# Altium schematic sheet Atrium_Charging_Case.SchDoc
size 420 x 297 mm; Symbol: Drawing-Symbol_A4; @Project Name: Atrium; @Page Count: 1; @Update Date: 2026-11-08; @Create Date: 2026-11-08; @Schematic Name: Schematic1; @Page No: 1; @Page Name: P1; Company: EasyEDA.com; Version: V1.0; Page Size: A4; Device: Drawing-Symbol_A4; @Create Time: 16:57:37; @Update Time: 16:57:37; Border: 1; Width: 1655; Height: 1170; Region Start: 1; X Region Count: 6; Y Region Count: 4; Blade Width: 10; Title Block Position: 3; @Board Name: Charging_Case
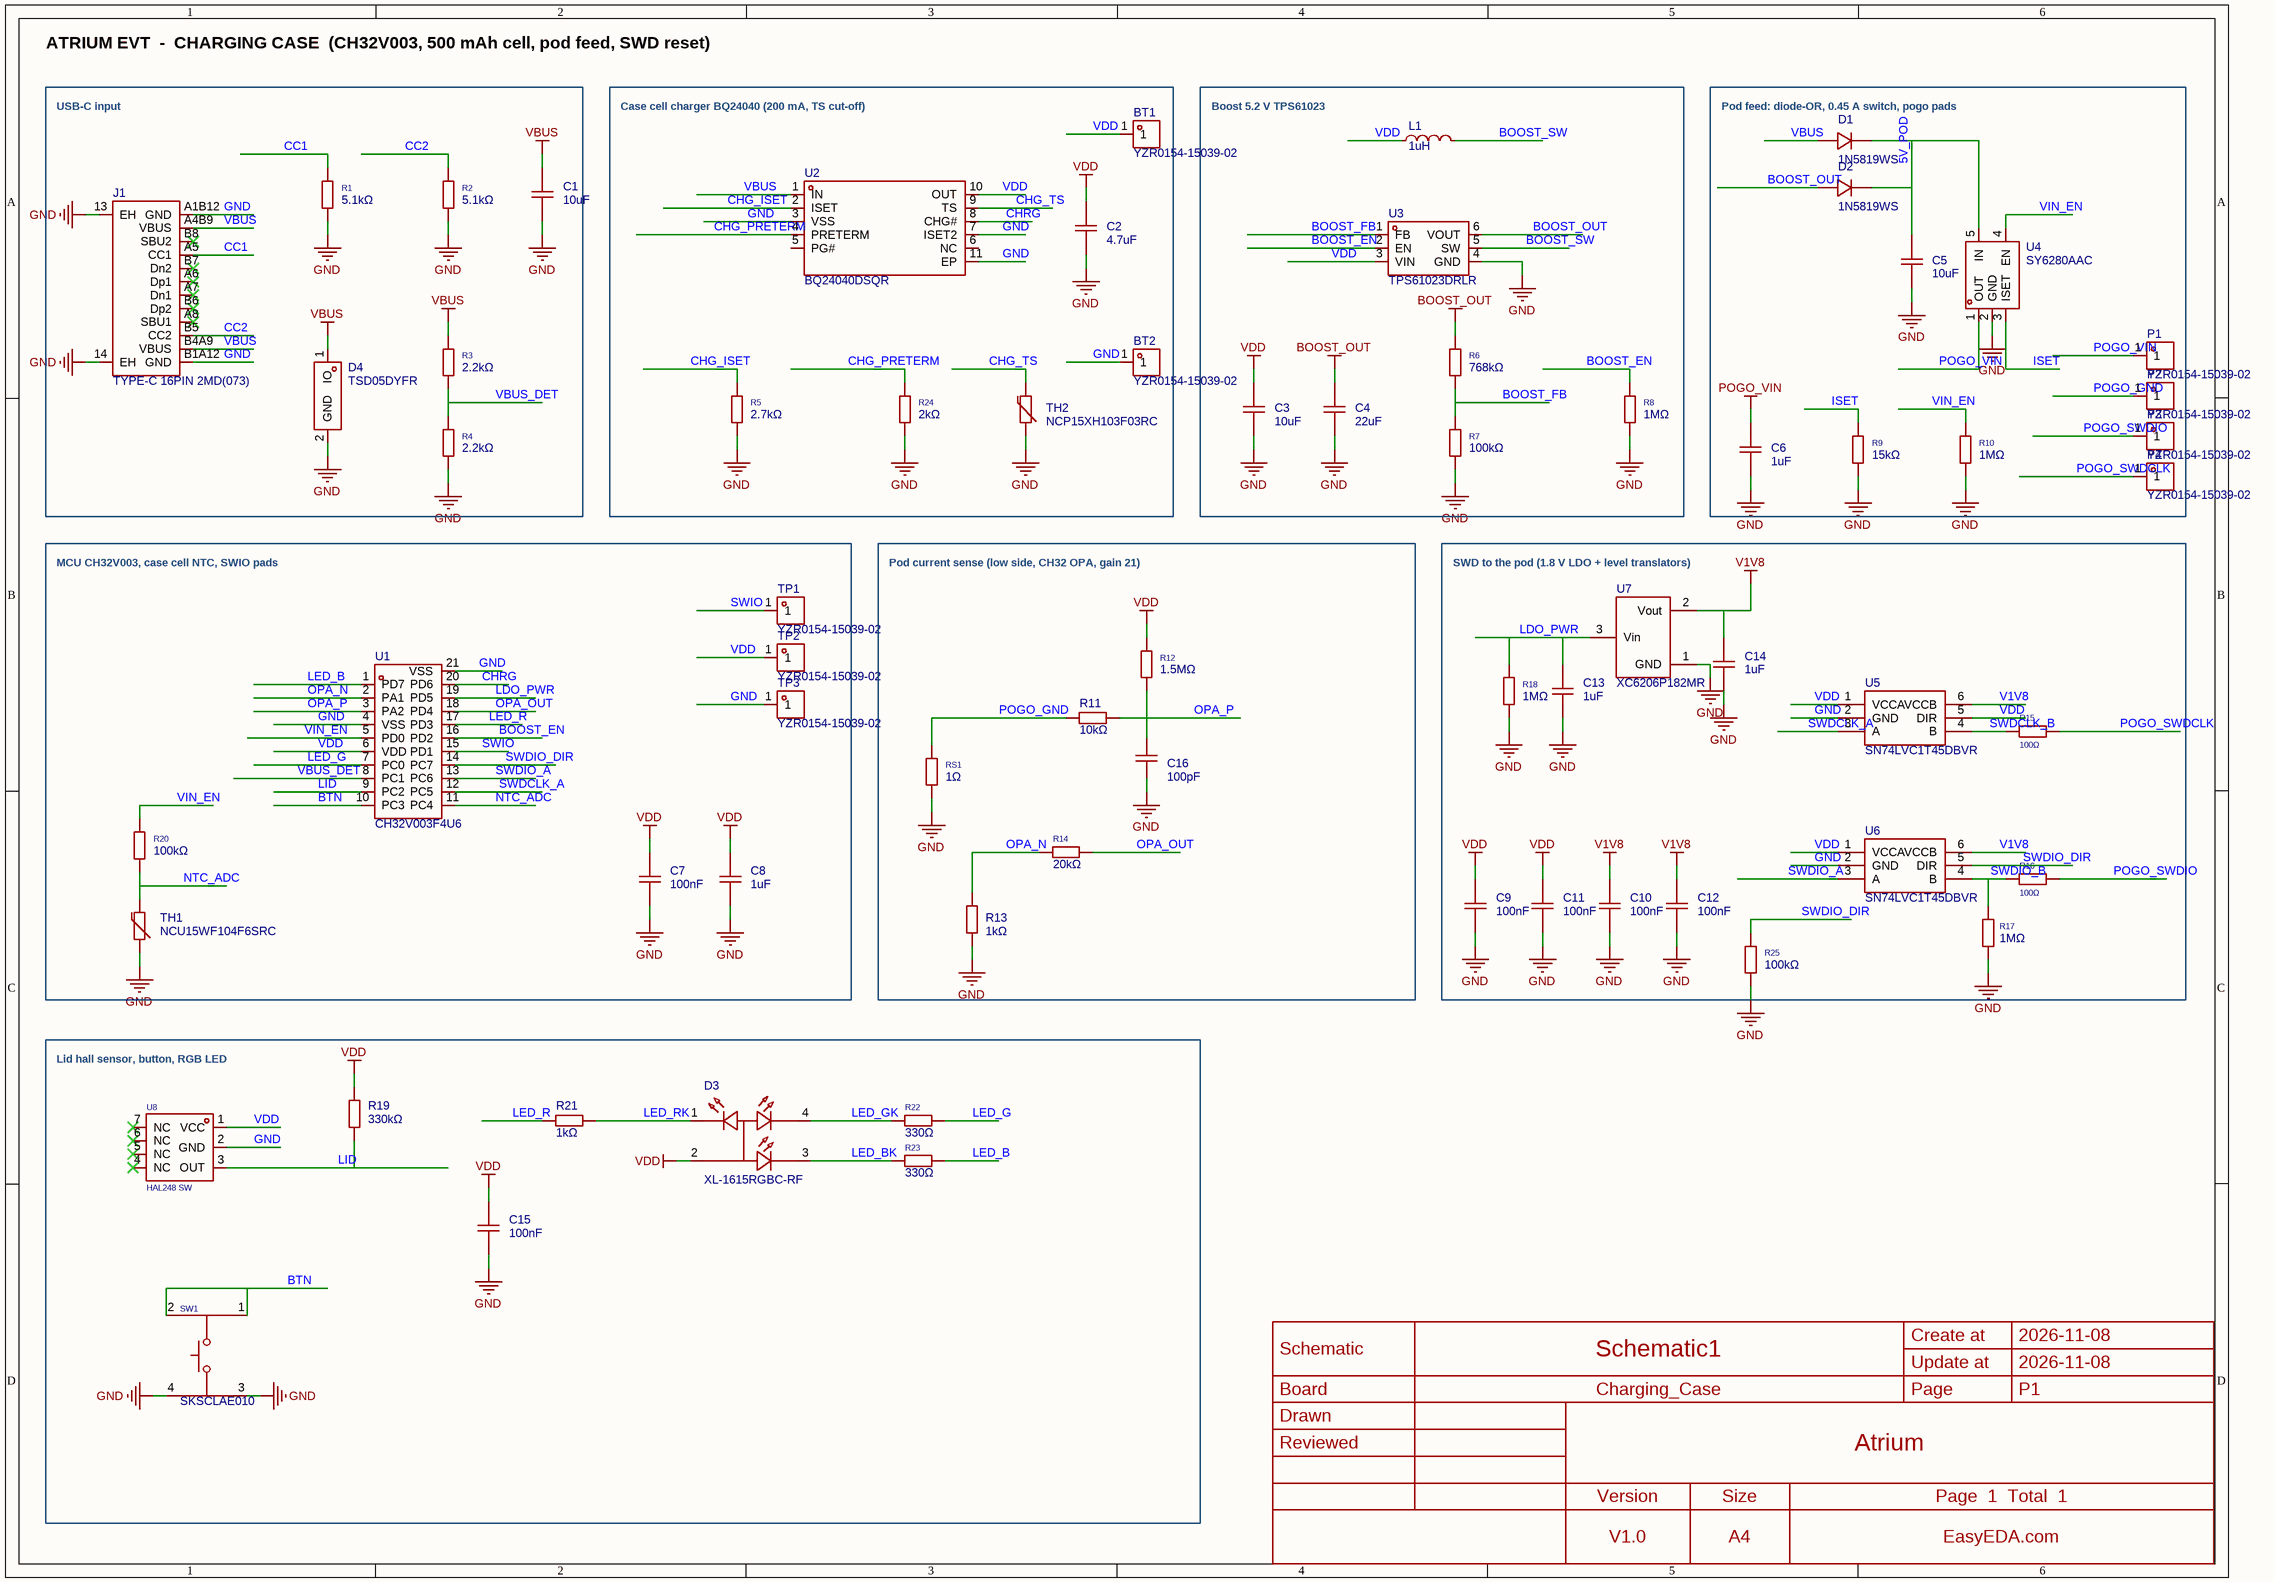
[diagram p0: Atrium_Charging_Case.SchDoc]

## Parts
BT1  YZR0154-15039-02  [TESTPOINT-SMD_BD1.5-H3.9]
BT2  YZR0154-15039-02  [TESTPOINT-SMD_BD1.5-H3.9]
C1  10uF  [C0603]
C2  4.7uF  [C0603]
C3  10uF  [C0603]
C4  22uF  [C0805]
C5  10uF  [C0603]
C6  1uF  [C0402]
C7  100nF  [C0402]
C8  1uF  [C0402]
C9  100nF  [C0402]
C10  100nF  [C0402]
C11  100nF  [C0402]
C12  100nF  [C0402]
C13  1uF  [C0402]
C14  1uF  [C0402]
C15  100nF  [C0402]
C16  100pF  [C0603]
D1  1N5819WS  [SOD-323_L1.8-W1.3-LS2.5-RD]
D2  1N5819WS  [SOD-323_L1.8-W1.3-LS2.5-RD]
D3  XL-1615RGBC-RF  [LED-ARRAY-SMD_4P-L1.6-W1.5-BR_XL-1615RGBC-RF]
D4  TSD05DYFR  [SOD-323_L1.7-W1.3-LS2.6_DYF0002A]
J1  TYPE-C 16PIN 2MD(073)  [USB-C-SMD_TYPE-C-16PIN-2MD-073]
L1  1uH  [IND-SMD_L2.5-W2.0_WPN252012H]
P1  YZR0154-15039-02  [TESTPOINT-SMD_BD1.5-H3.9]
P2  YZR0154-15039-02  [TESTPOINT-SMD_BD1.5-H3.9]
P3  YZR0154-15039-02  [TESTPOINT-SMD_BD1.5-H3.9]
P4  YZR0154-15039-02  [TESTPOINT-SMD_BD1.5-H3.9]
R1  5.1kΩ  [R0402]
R2  5.1kΩ  [R0402]
R3  2.2kΩ  [R0402]
R4  2.2kΩ  [R0402]
R5  2.7kΩ  [R0402]
R6  768kΩ  [R0402]
R7  100kΩ  [R0402]
R8  1MΩ  [R0402]
R9  15kΩ  [R0402]
R10  1MΩ  [R0402]
R11  10kΩ  [R0402]
R12  1.5MΩ  [R0402]
R13  1kΩ  [R0402]
R14  20kΩ  [R0402]
R15  100Ω  [R0402]
R16  100Ω  [R0402]
R17  1MΩ  [R0402]
R18  1MΩ  [R0402]
R19  330kΩ  [R0402]
R20  100kΩ  [R0402]
R21  1kΩ  [R0402]
R22  330Ω  [R0402]
R23  330Ω  [R0402]
R24  2kΩ  [R0402]
R25  100kΩ  [R0402]
RS1  1Ω  [R0603]
SW1  SKSCLAE010  [SW-SMD_4P-L3.5-W2.9-P1.30-LS4.8]
TH1  NCU15WF104F6SRC  [R0402]
TH2  NCP15XH103F03RC  [R0402]
TP1  YZR0154-15039-02  [TESTPOINT-SMD_BD1.5-H3.9]
TP2  YZR0154-15039-02  [TESTPOINT-SMD_BD1.5-H3.9]
TP3  YZR0154-15039-02  [TESTPOINT-SMD_BD1.5-H3.9]
U1  CH32V003F4U6  [QFN-20_L3.0-W3.0-P0.40-TL-EP1.7]
U2  BQ24040DSQR  [WSON-10_L2.0-W2.0-P0.40-BL-EP]
U3  TPS61023DRLR  [SOT-563-6_L1.6-W1.2-P0.5-LS1.6-BR]
U4  SY6280AAC  [SOT-23-5_L3.0-W1.7-P0.95-LS2.8-BL]
U5  SN74LVC1T45DBVR  [SOT-23-6_L2.9-W1.6-P0.95-LS2.8-BR]
U6  SN74LVC1T45DBVR  [SOT-23-6_L2.9-W1.6-P0.95-LS2.8-BR]
U7  XC6206P182MR  [SOT-23-3_L2.9-W1.6-P1.90-LS2.8-BR]
U8  HAL248 SW  [DFN-6_HAL248_SW]

## Blocks framed on the sheet
USB-C input: C1 D4 J1 R1-R4
Case cell charger BQ24040 (200 mA, TS cut-off): BT1 BT2 C2 R5 R24 TH2 U2
Boost 5.2 V TPS61023: C3 C4 L1 R6-R8 U3
Pod feed: diode-OR, 0.45 A switch, pogo pads: C5 C6 D1 D2 P1-P4 R9 R10 U4
MCU CH32V003, case cell NTC, SWIO pads: C7 C8 R20 TH1 TP1-TP3 U1
Pod current sense (low side, CH32 OPA, gain 21): C16 R11-R14 RS1
SWD to the pod (1.8 V LDO + level translators): C9-C14 R15-R18 R25 U5-U7
Lid hall sensor, button, RGB LED: C15 D3 R19 R21-R23 SW1 U8

## Nets
BOOST_OUT: C4.1 D2.2 R6.1 U3.6(VOUT)
GND: BT2.1 C1.2 C2.2 C3.2 C4.2 C5.2 C6.2 C7.2 C8.2 C9.2 C10.2 C11.2 C12.2 C13.2 C14.2 C15.2 C16.2 D4.2(GND) J1.13(EH) J1.14(EH) J1.A1B12(GND) J1.B1A12(GND) R1.2 R2.2 R4.2 R5.2 R7.2 R8.2 R9.2 R10.2 R13.2 R17.2 R18.2 R24.2 R25.2 RS1.2 SW1.3 SW1.4 TH1.2 TH2.2 TP3.1 U1.4(VSS) U1.21(VSS) U2.3(VSS) U2.7(ISET2) U2.11(EP) U3.4(GND) U4.2(GND) U5.2(GND) U6.2(GND) U7.1(GND) U8.2(GND)
POGO_VIN: C6.1 P1.1 U4.1(OUT)
V1V8: C10.1 C12.1 C14.1 U5.6(VCCB) U6.6(VCCB) U7.2(Vout)
VBUS: C1.1 D1.2 D4.1(IO) J1.A4B9(VBUS) J1.B4A9(VBUS) R3.1 U2.1(IN)
VDD: BT1.1 C2.1 C3.1 C7.1 C8.1 C9.1 C11.1 C15.1 D3.2(COM+) L1.1 R12.1 R19.1 TP2.1 U1.6(VDD) U2.10(OUT) U3.3(VIN) U5.1(VCCA) U5.5(DIR) U6.1(VCCA) U8.1(VCC)
5V_POD: C5.1 D1.1 D2.1 U4.5(IN)
BOOST_EN: R8.1 U1.16(PD2) U3.2(EN)
BOOST_FB: R6.2 R7.1 U3.1(FB)
BOOST_SW: L1.2 U3.5(SW)
BTN: SW1.1 SW1.2 U1.10(PC3)
CC1: J1.A5(CC1) R1.1
CC2: J1.B5(CC2) R2.1
CHG_ISET: R5.1 U2.2(ISET)
CHG_PRETERM: R24.1 U2.4(PRETERM)
CHG_TS: TH2.1 U2.9(TS)
CHRG: U1.20(PD6) U2.8(CHG#)
ISET: R9.1 U4.3(ISET)
LDO_PWR: C13.1 R18.1 U1.19(PD5) U7.3(Vin)
LED_B: R23.1 U1.1(PD7)
LED_BK: D3.3(B-) R23.2
LED_G: R22.1 U1.7(PC0)
LED_GK: D3.4(G-) R22.2
LED_R: R21.1 U1.17(PD3)
LED_RK: D3.1(R-) R21.2
LID: R19.2 U1.9(PC2) U8.3(OUT)
NTC_ADC: R20.2 TH1.1 U1.11(PC4)
OPA_N: R13.1 R14.1 U1.2(PA1)
OPA_OUT: R14.2 U1.18(PD4)
OPA_P: C16.1 R11.2 R12.2 U1.3(PA2)
POGO_GND: P2.1 R11.1 RS1.1
POGO_SWDCLK: P4.1 R15.2
POGO_SWDIO: P3.1 R16.2
SWDCLK_A: U1.12(PC5) U5.3(A)
SWDCLK_B: R15.1 U5.4(B)
SWDIO_A: U1.13(PC6) U6.3(A)
SWDIO_B: R16.1 R17.1 U6.4(B)
SWDIO_DIR: R25.1 U1.14(PC7) U6.5(DIR)
SWIO: TP1.1 U1.15(PD1)
VBUS_DET: R3.2 R4.1 U1.8(PC1)
VIN_EN: R10.1 R20.1 U1.5(PD0) U4.4(EN)

Not connected (* = marked no-connect by the designer): J1 A6(Dp1)* A7(Dn1)* A8(SBU1)* B6(Dp2)* B7(Dn2)* B8(SBU2)*; U2 5(PG#) 6(NC); U8 4(NC)* 5(NC)* 6(NC)* 7(NC)*

## Notes on the sheet
- ATRIUM EVT  -  CHARGING CASE  (CH32V003, 500 mAh cell, pod feed, SWD reset)
- Create at
- 2026-11-08
- Schematic
- Board
- Schematic1
- Charging_Case
- Update at
- Page
- P1
- Drawn
- Reviewed
- Atrium
- Version
- V1.0
- Size
- A4
- Page  1  Total  1
- EasyEDA.com

## Library data of the parts
BT1 BT2 P1-P4 TP1-TP3 = YZR0154-15039-02: Type:Pogo Pin Number of Pins:1P Overall Length/Height:3.9mm Operational Height:3.1mm Contact Resistance:50mΩ Elastic Life:10000 times Current Rating:1A Voltage Rating:12V Contact Material:Lead-Free Copper Contact Plating:Gold Operating Temperature:-20℃~+7; Manufacturer: Xinyangze(鑫扬泽); Add into BOM: no; Overall Length/Height: 3.9mm; Operational Height: 3.1mm; Contact Resistance: 50mΩ; Current Rating: 1A; Voltage Rating: 12V; Symbol: YZR0154-15039-02; Device: YZR0154-15039-02; Convert to PCB: no; LCSC Part Name: POGO PIN贴片型弹簧顶针; Supplier Part: C5157388; Manufacturer Part: YZR0154-15039-02; Supplier Footprint: -; JLCPCB Part Class: Extended Part; Datasheet: https://item.szlcsc.com/datasheet/YZR0154-15039-02/5795506.html; Supplier: LCSC; Type: Pogo Pin; Number of Pins: 1P; Elastic Life: 10000 times; Contact Material: Lead-Free Copper; Contact Plating: Gold; Operating Temperature: -20℃~+70℃; FootprintName: TESTPOINT-SMD_BD1.5-H3.9
C1 C3 C5 = CL10A106KP8NNNC: Capacitance:10uF Tolerance:±10% Tolerance:±10% Voltage Rating:10V Temperature Coefficient:X5R; Manufacturer: SAMSUNG(三星); Add into BOM: yes; 3D Model: 624118aa3cc7497086c383c2d72e08520819f05c4eef4c71ace90d822a990e87; 3D Model Transform: 62.992,31.496,0,0,0,0,0,0,0; Tolerance: ±10%; Voltage Rating: 10V; Temperature Coefficient: X5R; ModelName: C0603_L1.6-W0.8-H0.8; Symbol: CL10A106KP8NNNC; Device: CL10A106KP8NNNC; Convert to PCB: yes; LCSC Part Name: 10uF ±10% 10V; Supplier Part: C19702; Manufacturer Part: CL10A106KP8NNNC; Supplier Footprint: 0603; JLCPCB Part Class: Basic Part; Datasheet: https://item.szlcsc.com/datasheet/CL10A106KP8NNNC/20411.html; Supplier: LCSC; Value: 10uF; FootprintName: C0603
C2 = CL10A475KO8NNNC: Capacitance:4.7uF Tolerance:±10% Tolerance:±10% Voltage Rating:16V Temperature Coefficient:X5R; Manufacturer: SAMSUNG(三星); Add into BOM: yes; 3D Model: 624118aa3cc7497086c383c2d72e08520819f05c4eef4c71ace90d822a990e87; 3D Model Transform: 62.992,31.496,0,0,0,0,0,0,0; Tolerance: ±10%; Voltage Rating: 16V; Temperature Coefficient: X5R; ModelName: C0603_L1.6-W0.8-H0.8; Symbol: CL10A475KO8NNNC; Device: CL10A475KO8NNNC; Convert to PCB: yes; LCSC Part Name: 4.7uF ±10% 16V; Supplier Part: C19666; Manufacturer Part: CL10A475KO8NNNC; Supplier Footprint: 0603; JLCPCB Part Class: Basic Part; Datasheet: https://item.szlcsc.com/datasheet/CL10A475KO8NNNC/20375.html; Supplier: LCSC; Value: 4.7uF; FootprintName: C0603
C4 = CL21A226MAQNNNE: Capacitance:22uF Tolerance:±20% Tolerance:±20% Voltage Rating:25V Temperature Coefficient:X5R; Manufacturer: SAMSUNG(三星); Manufacturer Part: CL21A226MAYNNNE; Add into BOM: yes; Tolerance: ±20%; Voltage Rating: 25V; Temperature Coefficient: X5R; ModelId: 8c88e81f49c6409b980720ec8953afb60819f05c4eef4c71ace90d822a990e87; ModelName: C0805_L2.0-W1.3-H1.3; ModelTransform: 78.74,51.181,0,0,0,0,0,0.0005,0; Symbol: CL21A226MAQNNNE; Device: CL21A226MAQNNNE; Convert to PCB: yes; Supplier: LCSC; Supplier Part: C602037; LCSC Part Name: 22uF ±20% 25V; Supplier Footprint: 0805; JLCPCB Part Class: Basic Part; Datasheet: https://item.szlcsc.com/datasheet/CL21A226MAQNNNE/46786.html; Value: 22uF; FootprintName: C0805
C6 C8 C13 C14 = CL05A105KA5NQNC: Capacitance:1uF Tolerance:±10% Tolerance:±10% Voltage Rating:25V Temperature Coefficient:X5R; Manufacturer: SAMSUNG(三星); Add into BOM: yes; 3D Model: b7d13df3e9464d7a99d0651d1a5b4d570819f05c4eef4c71ace90d822a990e87; 3D Model Transform: 39.37,19.685,0,0,0,0,0,0,0; Tolerance: ±10%; Voltage Rating: 25V; Temperature Coefficient: X5R; ModelName: C0402_L1.0-W0.5-H0.5; Symbol: CL05A105KA5NQNC; Device: CL05A105KA5NQNC; Convert to PCB: yes; LCSC Part Name: 1uF ±10% 25V; Supplier Part: C52923; Manufacturer Part: CL05A105KA5NQNC; Supplier Footprint: 0402; JLCPCB Part Class: Basic Part; Datasheet: https://item.szlcsc.com/datasheet/CL05A105KA5NQNC/53938.html; Supplier: LCSC; Value: 1uF; FootprintName: C0402
C7 C9-C12 C15 = CL05B104KO5NNNC: Capacitance:100nF Tolerance:±10% Tolerance:±10% Voltage Rating:16V Temperature Coefficient:X7R; Manufacturer: SAMSUNG(三星); Add into BOM: yes; 3D Model: b7d13df3e9464d7a99d0651d1a5b4d570819f05c4eef4c71ace90d822a990e87; 3D Model Transform: 39.37,19.685,0,0,0,0,0,0,0; Tolerance: ±10%; Voltage Rating: 16V; Temperature Coefficient: X7R; ModelName: C0402_L1.0-W0.5-H0.5; Symbol: CL05B104KO5NNNC; Device: CL05B104KO5NNNC; Convert to PCB: yes; LCSC Part Name: 100nF ±10% 16V; Supplier Part: C1525; Manufacturer Part: CL05B104KO5NNNC; Supplier Footprint: 0402; JLCPCB Part Class: Basic Part; Datasheet: https://item.szlcsc.com/datasheet/CL05B104KO5NNNC/1877.html; Supplier: LCSC; Value: 100nF; FootprintName: C0402
C16 = CL10C101JB8NNNC: Capacitance:100pF Tolerance:±5% Tolerance:±5% Voltage Rating:50V Temperature Coefficient:C0G; Manufacturer: SAMSUNG(三星); Add into BOM: yes; Tolerance: ±5%; Voltage Rating: 50V; Temperature Coefficient: C0G; ModelId: 624118aa3cc7497086c383c2d72e08520819f05c4eef4c71ace90d822a990e87; ModelName: C0603_L1.6-W0.8-H0.8; ModelTransform: 62.992,31.496,0,0,0,0,0,0,0; Symbol: CL10C101JB8NNNC; Device: CL10C101JB8NNNC; Convert to PCB: yes; Manufacturer Part: CL10C101JB8NNNC; Supplier: LCSC; Supplier Part: C14858; LCSC Part Name: 100pF ±5% 50V; Supplier Footprint: 0603; JLCPCB Part Class: Basic Part; Datasheet: https://item.szlcsc.com/datasheet/CL10C101JB8NNNC/15530.html; Value: 100pF; FootprintName: C0603
D1 D2 = B5819WS: Forward Voltage (Vf@If):600mV@1A Reverse Voltage (Vr):40V Average Rectified Current (Io):1A; Manufacturer: Hottech(合科泰); Symbol: B5819WS_C179554; Add into BOM: yes; Reverse Voltage (Vr): 40V; Average Rectified Current (Io): 1A; ModelId: 533ebfb2f206414f9035ed0ccba1097d0819f05c4eef4c71ace90d822a990e87; ModelTransform: 104.3305,51.181,0,0,0,0,0,-0.004,0; Device: B5819WS; Convert to PCB: yes; Manufacturer Part: 1N5819WS; Supplier: LCSC; Supplier Part: C191023; LCSC Part Name: 电压:40V 电流:1A; Supplier Footprint: SOD-323; JLCPCB Part Class: Extended Part; Datasheet: https://atta.szlcsc.com/upload/public/pdf/source/20180131/C179554_15173931515471329165.pdf; Forward Voltage (Vf@If): 600mV@1A; FootprintName: SOD-323_L1.8-W1.3-LS2.5-RD; ModelName: SOD-323_L1.8-W1.3-LS2.5-RD
D3 = XL-1615RGBC-RF: Diode Configuration:Common Anode Dominant Wavelength - R:620nm~625nm Dominant Wavelength - R:620nm~625nm Dominant Wavelength - G:515nm~530nm Dominant Wavelength - G:515nm~530nm Dominant Wavelength - B:460nm~470nm Dominant Wavelength - B:460nm~470nm Viewin; Manufacturer: XINGLIGHT(成兴光); Add into BOM: yes; Viewing Angle: 120°; Lens Color: Water Clear; Antistatic Capacity: B:2000V；R:2000V；G:2000V; Peak Wavelength - R: 625nm; Peak Wavelength - G: 515nm; Peak Wavelength - B: 465nm; Installation Method: Top-mount; Luminous Intensity - R: 100mcd~180mcd; Luminous Intensity - G: 350mcd~800mcd; Luminous Intensity - B: 120mcd~180mcd; Forward Voltage(Vf) - R: 1.8V~2.4V; Forward Voltage(Vf) - G: 2.6V~3.4V; Forward Current - R: 20mA; Power(Watts) - R: 50mW; Power(Watts) - G: 70mW; ModelId: 6557e66919bb465dbfbf77dbddbd30e00819f05c4eef4c71ace90d822a990e87; ModelTransform: 63.823,59.4487,0,0,0,0,0,0,0; Symbol: XL-1615RGBC-RF; Device: XL-1615RGBC-RF; Convert to PCB: yes; Manufacturer Part: XL-1615RGBC-RF; Supplier: LCSC; Supplier Part: C965840; LCSC Part Name: 1615七彩（共阳）贴片式发光二极管; Supplier Footprint: SMD-4P,1.6x1.5mm; JLCPCB Part Class: Extended Part; Datasheet: https://item.szlcsc.com/datasheet/XL-1615RGBC-RF/1051449.html; Diode Configuration: Common Anode; Dominant Wavelength - R: 620nm~625nm; Dominant Wavelength - G: 515nm~530nm; Dominant Wavelength - B: 460nm~470nm; Operating Temperature: -30℃~+85℃; Lamp Holder Type: -; Length: 1.6mm; Width: 1.5mm; Height: 0.6mm; Pitch: -; Forward Voltage(Vf) - B: 2.6V~3.4V; Forward Current - G: 20mA; Forward Current - B: 20mA; Power(Watts) - B: 70mW; FootprintName: LED-ARRAY-SMD_4P-L1.6-W1.5-BR_XL-1615RGBC-RF; ModelName: LED-ARRAY-SMD_4P-L1.6-W1.5-BR_XL-1615RGBC-RF
D4 = TSD05DYFR: Reverse Stand-Off Voltage (Vrwm):5.5V Clamping Voltage:15V Peak Pulse Current (Ipp):60A@8/20us Peak Pulse Power Dissipation (Ppp):529W@8/20us Voltage - Breakdown:6V Reverse Leakage Current (Ir):50nA Operating Temperature:-55℃~+150℃ Operating Temperature:-; Manufacturer: TI(德州仪器); Add into BOM: yes; Reverse Stand-Off Voltage (Vrwm): 5.5V; Clamping Voltage: 15V; Voltage - Breakdown: 6V; Reverse Leakage Current (Ir): 50nA; level of protection: IEC 61000-4-5；IEC 61000-4-2; Type: TVS; Junction Capacitance: 19pF; Symbol: TSD05DYFR; Device: TSD05DYFR; Convert to PCB: yes; Manufacturer Part: TSD05DYFR; Supplier: LCSC; Supplier Part: C22396185; LCSC Part Name: 5V单向TVS二极管; Supplier Footprint: SOD-323; JLCPCB Part Class: Extended Part; Datasheet: https://www.ti.com.cn/cn/lit/ds/symlink/tsd05.pdf?ts=1739398730409; Peak Pulse Current (Ipp): 60A@8/20us; Peak Pulse Power Dissipation (Ppp): 529W@8/20us; Operating Temperature: -55℃~+150℃; FootprintName: SOD-323_L1.7-W1.3-LS2.6_DYF0002A
J1 = TYPE-C 16PIN 2MD(073): Connector Type:Type-C Protocol Standard:- Gender:Female Mounting Type:Surface Mount, Right Angle Number of Contacts:16P Number of Ports:1 Current Rating-Power:3A Voltage Rating:5V Connect-Disconnect Life:10,000 cycles Supplementary Features:- Center Heigh; Manufacturer: SHOU HAN(首韩); Add into BOM: yes; Gender: Female; Number of Contacts: 16P; Number of Ports: 1; Current Rating-Power: 3A; Voltage Rating: 5V; Detection color: Black; ModelId: e7514eef573e45b68df9e9a6124b25320819f05c4eef4c71ace90d822a990e87; ModelName: USB-C-SMD_TYPE-C-6PIN-2MD-073; ModelTransform: 351.9678,298.4246,0,0,0,0,0,-47.244,-35.433; Symbol: TYPE-C 16PIN 2MD(073); Device: TYPE-C 16PIN 2MD(073); Convert to PCB: yes; Manufacturer Part: TYPE-C 16PIN 2MD(073); Supplier: LCSC; Supplier Part: C2765186; LCSC Part Name: Type-C 母 卧贴; Supplier Footprint: SMD; JLCPCB Part Class: Extended Part; Datasheet: https://item.szlcsc.com/datasheet/TYPE-C%252016PIN%25202MD(073)/2901843.html; Connector Type: Type-C; Protocol Standard: -; Mounting Type: Surface Mount, Right Angle; Connect-Disconnect Life: 10,000 cycles; Supplementary Features: -; Center Height: -; Length: 7.35mm; Operating Temperature: -25℃~+85℃; FootprintName: USB-C-SMD_TYPE-C-16PIN-2MD-073
L1 = WPN252012H1R0MT: Inductance:1uH Tolerance:±20% Tolerance:±20% Current Rating:3A Current - Saturation(Isat):4.2A DC Resistance(DCR):54mΩ Type:- Ratings:-; Manufacturer: Sunlord(顺络); Add into BOM: yes; Tolerance: ±20%; Current Rating: 3A; Current - Saturation(Isat): 4.2A; DC Resistance(DCR): 54mΩ; ModelId: f5625bf16a6742aea4d8c0784f02ade50819f05c4eef4c71ace90d822a990e87; ModelName: IND-SMD_L2.5-W2.0-H1.2-252012; ModelTransform: 78.74,99.2124,0,90,0,0,0,0,0; Symbol: WPN252012H1R0MT; Device: WPN252012H1R0MT; Convert to PCB: yes; Manufacturer Part: WPN252012H1R0MT; Supplier: LCSC; Supplier Part: C98348; LCSC Part Name: 1uH ±20% 4.2A; Supplier Footprint: 1008; JLCPCB Part Class: Extended Part; Datasheet: https://item.szlcsc.com/datasheet/WPN252012H1R0MT/99557.html; Value: 1uH; Type: -; Ratings: -; FootprintName: IND-SMD_L2.5-W2.0_WPN252012H
R1 R2 = 0402WGF5101TCE: Type:Thick Film Resistor Resistance:5.1kΩ Tolerance:±1% Tolerance:±1% Power(Watts):62.5mW Voltage-Supply(Max):50V Temperature Coefficient:±100ppm/℃ Temperature Coefficient:±100ppm/℃ Operating Temperature:-55℃~+155℃ Operating Temperature:-55℃~+155℃; Manufacturer: UNI-ROYAL(厚声); Add into BOM: yes; 3D Model: efdecb7dae4442949d28eecaf748420f0819f05c4eef4c71ace90d822a990e87; 3D Model Transform: 39.37,19.685,0,0,0,0,0,0,0; Tolerance: ±1%; Power(Watts): 62.5mW; Voltage-Supply(Max): 50V; ModelName: R0402_L1.0-W0.5-H0.4; Symbol: 0402WGF5101TCE; Device: 0402WGF5101TCE; Convert to PCB: yes; LCSC Part Name: 厚膜电阻 5.1kΩ ±1%; Supplier Footprint: 0402; Datasheet: https://item.szlcsc.com/datasheet/0402WGF5101TCE/26648.html; Type: Thick Film Resistor; Temperature Coefficient: ±100ppm/℃; Operating Temperature: -55℃~+155℃; Manufacturer Part: 0402WGF5101TCE; Supplier: LCSC; Supplier Part: C25905; Value: 5.1kΩ; JLCPCB Part Class: Basic Part; FootprintName: R0402
R3 R4 = 0402WGF2201TCE: Type:Thick Film Resistor Resistance:2.2kΩ Tolerance:±1% Tolerance:±1% Power(Watts):62.5mW Voltage-Supply(Max):50V Temperature Coefficient:±100ppm/℃ Temperature Coefficient:±100ppm/℃ Operating Temperature:-55℃~+155℃ Operating Temperature:-55℃~+155℃; Manufacturer: UNI-ROYAL(厚声); Add into BOM: yes; Tolerance: ±1%; Power(Watts): 62.5mW; Voltage-Supply(Max): 50V; ModelId: efdecb7dae4442949d28eecaf748420f0819f05c4eef4c71ace90d822a990e87; ModelName: R0402_L1.0-W0.5-H0.4; ModelTransform: 39.37,19.685,0,0,0,0,0,0,0; Symbol: 0402WGF2201TCE; Device: 0402WGF2201TCE; Convert to PCB: yes; Manufacturer Part: 0402WGF2201TCE; Supplier: LCSC; Supplier Part: C25879; Value: 2.2kΩ; JLCPCB Part Class: Basic Part; LCSC Part Name: 厚膜电阻 2.2kΩ ±1%; Supplier Footprint: 0402; Datasheet: https://item.szlcsc.com/datasheet/0402WGF2201TCE/26622.html; Type: Thick Film Resistor; Temperature Coefficient: ±100ppm/℃; Operating Temperature: -55℃~+155℃; FootprintName: R0402
R5 = 0402WGF2701TCE: Type:Thick Film Resistor Resistance:2.7kΩ Tolerance:±1% Tolerance:±1% Power(Watts):62.5mW Voltage-Supply(Max):50V Temperature Coefficient:±100ppm/℃ Temperature Coefficient:±100ppm/℃ Operating Temperature:-55℃~+155℃ Operating Temperature:-55℃~+155℃; Manufacturer: UNI-ROYAL(厚声); Add into BOM: yes; Tolerance: ±1%; Power(Watts): 62.5mW; Voltage-Supply(Max): 50V; ModelId: efdecb7dae4442949d28eecaf748420f0819f05c4eef4c71ace90d822a990e87; ModelName: R0402_L1.0-W0.5-H0.4; ModelTransform: 39.37,19.685,0,0,0,0,0,0,0; Symbol: 0402WGF2701TCE; Device: 0402WGF2701TCE; Convert to PCB: yes; Manufacturer Part: 0402WGF2701TCE; Supplier: LCSC; Supplier Part: C25885; Value: 2.7kΩ; JLCPCB Part Class: Extended Part; LCSC Part Name: 厚膜电阻 2.7kΩ ±1%; Supplier Footprint: 0402; Datasheet: https://item.szlcsc.com/datasheet/0402WGF2701TCE/26628.html; Type: Thick Film Resistor; Temperature Coefficient: ±100ppm/℃; Operating Temperature: -55℃~+155℃; FootprintName: R0402
R6 = 0402WGF7683TCE: Type:Thick Film Resistor Resistance:768kΩ Tolerance:±1% Tolerance:±1% Power(Watts):62.5mW Voltage-Supply(Max):50V Temperature Coefficient:±100ppm/℃ Temperature Coefficient:±100ppm/℃ Operating Temperature:-55℃~+155℃ Operating Temperature:-55℃~+155℃; Manufacturer: UNI-ROYAL(厚声); Add into BOM: yes; Tolerance: ±1%; Power(Watts): 62.5mW; Voltage-Supply(Max): 50V; ModelId: efdecb7dae4442949d28eecaf748420f0819f05c4eef4c71ace90d822a990e87; ModelName: R0402_L1.0-W0.5-H0.4; ModelTransform: 39.37,19.685,0,0,0,0,0,0,0; Symbol: 0402WGF7683TCE; Device: 0402WGF7683TCE; Convert to PCB: yes; Manufacturer Part: 0402WGF7683TCE; Supplier: LCSC; Supplier Part: C27017; Value: 768kΩ; JLCPCB Part Class: Extended Part; LCSC Part Name: 厚膜电阻 768kΩ ±1%; Supplier Footprint: 0402; Datasheet: https://item.szlcsc.com/datasheet/0402WGF7683TCE/27766.html; Type: Thick Film Resistor; Temperature Coefficient: ±100ppm/℃; Operating Temperature: -55℃~+155℃; FootprintName: R0402
R7 R20 = 0402WGF1003TCE: Type:Thick Film Resistor Resistance:100kΩ Tolerance:±1% Tolerance:±1% Power(Watts):62.5mW Voltage-Supply(Max):50V Temperature Coefficient:±100ppm/℃ Temperature Coefficient:±100ppm/℃ Operating Temperature:-55℃~+155℃ Operating Temperature:-55℃~+155℃; Manufacturer: UNI-ROYAL(厚声); Add into BOM: yes; Tolerance: ±1%; Power(Watts): 62.5mW; Voltage-Supply(Max): 50V; ModelId: efdecb7dae4442949d28eecaf748420f0819f05c4eef4c71ace90d822a990e87; ModelName: R0402_L1.0-W0.5-H0.4; ModelTransform: 39.37,19.685,0,0,0,0,0,0,0; Symbol: 0402WGF1003TCE; Device: 0402WGF1003TCE; Convert to PCB: yes; Manufacturer Part: 0402WGF1003TCE; Supplier: LCSC; Supplier Part: C25741; Value: 100kΩ; JLCPCB Part Class: Basic Part; LCSC Part Name: 厚膜电阻 100kΩ ±1%; Supplier Footprint: 0402; Datasheet: https://item.szlcsc.com/datasheet/0402WGF1003TCE/26484.html; Type: Thick Film Resistor; Temperature Coefficient: ±100ppm/℃; Operating Temperature: -55℃~+155℃; FootprintName: R0402
R8 R10 R17 R18 = 0402WGF1004TCE: Type:Thick Film Resistor Resistance:1MΩ Tolerance:±1% Tolerance:±1% Power(Watts):62.5mW Voltage-Supply(Max):50V Temperature Coefficient:±100ppm/℃ Temperature Coefficient:±100ppm/℃ Operating Temperature:-55℃~+155℃ Operating Temperature:-55℃~+155℃; Manufacturer: UNI-ROYAL(厚声); Add into BOM: yes; 3D Model: efdecb7dae4442949d28eecaf748420f0819f05c4eef4c71ace90d822a990e87; 3D Model Transform: 39.37,19.685,0,0,0,0,0,0,0; Tolerance: ±1%; Power(Watts): 62.5mW; Voltage-Supply(Max): 50V; ModelName: R0402_L1.0-W0.5-H0.4; Symbol: 0402WGF1004TCE; Device: 0402WGF1004TCE; Convert to PCB: yes; LCSC Part Name: 1MΩ ±1% 62.5mW 厚膜电阻; Supplier Footprint: 0402; Datasheet: https://item.szlcsc.com/datasheet/0402WGF1004TCE/26826.html; Type: Thick Film Resistor; Temperature Coefficient: ±100ppm/℃; Operating Temperature: -55℃~+155℃; Manufacturer Part: 0402WGF1004TCE; Supplier: LCSC; Supplier Part: C26083; Value: 1MΩ; JLCPCB Part Class: Basic Part; FootprintName: R0402
R9 = 0402WGF1502TCE: Type:Thick Film Resistors Resistance:15kΩ Tolerance:±1% Tolerance:±1% Power(Watts): Overload Voltage (Max): Temperature Coefficient:±100ppm/℃ Temperature Coefficient:±100ppm/℃ Operating Temperature Range:-55℃~+155℃ Operating Temperature Range:-55℃~+155℃; Manufacturer: UNI-ROYAL(厚声); Add into BOM: yes; Tolerance: ±1%; ModelId: efdecb7dae4442949d28eecaf748420f0819f05c4eef4c71ace90d822a990e87; ModelName: R0402_L1.0-W0.5-H0.4; ModelTransform: 39.37,19.685,0,0,0,0,0,0,0; Symbol: 0402WGF1502TCE; Device: 0402WGF1502TCE; Convert to PCB: yes; Manufacturer Part: 0402WGF1502TCE; Supplier: LCSC; Supplier Part: C25756; Value: 15kΩ; JLCPCB Part Class: Basic Part; LCSC Part Name: 15kΩ ±1% 62.5mW 厚膜电阻; Supplier Footprint: 0402; Datasheet: https://atta.szlcsc.com/upload/public/pdf/source/20200306/C422600_1E6D84923E4A46A82E41ADD87F860B5C.pdf; Type: Thick Film Resistors; Temperature Coefficient: ±100ppm/℃; Operating Temperature Range: -55℃~+155℃; FootprintName: R0402
R11 = 0402WGF1002TCE: Type:Thick Film Resistor Resistance:10kΩ Tolerance:±1% Tolerance:±1% Power(Watts):62.5mW Voltage-Supply(Max):50V Temperature Coefficient:±100ppm/℃ Temperature Coefficient:±100ppm/℃ Operating Temperature:-55℃~+155℃ Operating Temperature:-55℃~+155℃; Manufacturer: UNI-ROYAL(厚声); Add into BOM: yes; Tolerance: ±1%; Power(Watts): 62.5mW; Voltage-Supply(Max): 50V; ModelId: efdecb7dae4442949d28eecaf748420f0819f05c4eef4c71ace90d822a990e87; ModelName: R0402_L1.0-W0.5-H0.4; ModelTransform: 39.37,19.685,0,0,0,0,0,0,0; Symbol: 0402WGF1002TCE; Device: 0402WGF1002TCE; Convert to PCB: yes; Manufacturer Part: 0402WGF1002TCE; Supplier: LCSC; Supplier Part: C25744; LCSC Part Name: 厚膜电阻 10kΩ ±1%; Supplier Footprint: 0402; JLCPCB Part Class: Basic Part; Datasheet: https://item.szlcsc.com/datasheet/0402WGF1002TCE/26487.html; Type: Thick Film Resistor; Value: 10kΩ; Temperature Coefficient: ±100ppm/℃; Operating Temperature: -55℃~+155℃; FootprintName: R0402
R12 = 0402WGF1504TCE: Type:Thick Film Resistor Resistance:1.5MΩ Tolerance:±1% Tolerance:±1% Power(Watts):62.5mW Voltage-Supply(Max):50V Temperature Coefficient:±100ppm/℃ Temperature Coefficient:±100ppm/℃ Operating Temperature:-55℃~+155℃ Operating Temperature:-55℃~+155℃; Manufacturer: UNI-ROYAL(厚声); Add into BOM: yes; Tolerance: ±1%; Power(Watts): 62.5mW; Voltage-Supply(Max): 50V; ModelId: efdecb7dae4442949d28eecaf748420f0819f05c4eef4c71ace90d822a990e87; ModelName: R0402_L1.0-W0.5-H0.4; ModelTransform: 39.37,19.685,0,0,0,0,0,0,0; Symbol: 0402WGF1504TCE; Device: 0402WGF1504TCE; Convert to PCB: yes; Manufacturer Part: 0402WGF1504TCE; Supplier: LCSC; Supplier Part: C22276; Value: 1.5MΩ; JLCPCB Part Class: Extended Part; LCSC Part Name: 厚膜电阻 1.5MΩ ±1%; Supplier Footprint: 0402; Datasheet: https://item.szlcsc.com/datasheet/0402WGF1504TCE/23001.html; Type: Thick Film Resistor; Temperature Coefficient: ±100ppm/℃; Operating Temperature: -55℃~+155℃; FootprintName: R0402
R13 R21 = 0402WGF1001TCE: Type:Thick Film Resistor Resistance:1kΩ Tolerance:±1% Tolerance:±1% Power(Watts):62.5mW Voltage-Supply(Max):50V Temperature Coefficient:±100ppm/℃ Temperature Coefficient:±100ppm/℃ Operating Temperature:-55℃~+155℃ Operating Temperature:-55℃~+155℃; Manufacturer: UNI-ROYAL(厚声); Add into BOM: yes; 3D Model: efdecb7dae4442949d28eecaf748420f0819f05c4eef4c71ace90d822a990e87; 3D Model Transform: 39.37,19.685,0,0,0,0,0,0,0; Tolerance: ±1%; Power(Watts): 62.5mW; Voltage-Supply(Max): 50V; ModelName: R0402_L1.0-W0.5-H0.4; Symbol: 0402WGF1001TCE; Device: 0402WGF1001TCE; Convert to PCB: yes; LCSC Part Name: 厚膜电阻 1kΩ ±1%; Supplier Part: C11702; Manufacturer Part: 0402WGF1001TCE; Supplier Footprint: 0402; JLCPCB Part Class: Basic Part; Datasheet: https://item.szlcsc.com/datasheet/0402WGF1001TCE/12256.html; Supplier: LCSC; Type: Thick Film Resistor; Value: 1kΩ; Temperature Coefficient: ±100ppm/℃; Operating Temperature: -55℃~+155℃; FootprintName: R0402
R14 = 0402WGF2002TCE: Type:Thick Film Resistors Resistance:20kΩ Tolerance:±1% Tolerance:±1% Power(Watts): Overload Voltage (Max): Temperature Coefficient:±100ppm/℃ Temperature Coefficient:±100ppm/℃ Operating Temperature Range:-55℃~+155℃ Operating Temperature Range:-55℃~+155℃; Manufacturer: UNI-ROYAL(厚声); Add into BOM: yes; Tolerance: ±1%; ModelId: efdecb7dae4442949d28eecaf748420f0819f05c4eef4c71ace90d822a990e87; ModelName: R0402_L1.0-W0.5-H0.4; ModelTransform: 39.37,19.685,0,0,0,0,0,0,0; Symbol: 0402WGF2002TCE; Device: 0402WGF2002TCE; Convert to PCB: yes; Manufacturer Part: 0402WGF2002TCE; Supplier: LCSC; Supplier Part: C25765; Value: 20kΩ; JLCPCB Part Class: Basic Part; LCSC Part Name: 20kΩ ±1% 62.5mW 厚膜电阻; Supplier Footprint: 0402; Datasheet: https://atta.szlcsc.com/upload/public/pdf/source/20200306/C422600_1E6D84923E4A46A82E41ADD87F860B5C.pdf; Type: Thick Film Resistors; Temperature Coefficient: ±100ppm/℃; Operating Temperature Range: -55℃~+155℃; FootprintName: R0402
R15 R16 = 0402WGF1000TCE: Type:Thick Film Resistor Resistance:100Ω Tolerance:±1% Tolerance:±1% Power(Watts):62.5mW Voltage-Supply(Max):50V Temperature Coefficient:±100ppm/℃ Temperature Coefficient:±100ppm/℃ Operating Temperature:-55℃~+155℃ Operating Temperature:-55℃~+155℃; Manufacturer: UNI-ROYAL(厚声); Add into BOM: yes; Tolerance: ±1%; Power(Watts): 62.5mW; Voltage-Supply(Max): 50V; ModelId: efdecb7dae4442949d28eecaf748420f0819f05c4eef4c71ace90d822a990e87; ModelName: R0402_L1.0-W0.5-H0.4; ModelTransform: 39.37,19.685,0,0,0,0,0,0,0; Symbol: 0402WGF1000TCE; Device: 0402WGF1000TCE; Convert to PCB: yes; Manufacturer Part: 0402WGF1000TCE; Supplier: LCSC; Supplier Part: C25076; LCSC Part Name: 厚膜电阻 100Ω ±1%; Supplier Footprint: 0402; JLCPCB Part Class: Basic Part; Datasheet: https://item.szlcsc.com/datasheet/0402WGF1000TCE/25819.html; Type: Thick Film Resistor; Value: 100Ω; Temperature Coefficient: ±100ppm/℃; Operating Temperature: -55℃~+155℃; FootprintName: R0402
R19 = 0402WGF3303TCE: Type:Thick Film Resistor Resistance:330kΩ Tolerance:±1% Tolerance:±1% Power(Watts):62.5mW Voltage-Supply(Max):50V Temperature Coefficient:±100ppm/℃ Temperature Coefficient:±100ppm/℃ Operating Temperature:-55℃~+155℃ Operating Temperature:-55℃~+155℃; Manufacturer: UNI-ROYAL(厚声); Add into BOM: yes; Tolerance: ±1%; Power(Watts): 62.5mW; Voltage-Supply(Max): 50V; ModelId: efdecb7dae4442949d28eecaf748420f0819f05c4eef4c71ace90d822a990e87; ModelName: R0402_L1.0-W0.5-H0.4; ModelTransform: 39.37,19.685,0,0,0,0,0,0,0; Symbol: 0402WGF3303TCE; Device: 0402WGF3303TCE; Convert to PCB: yes; Manufacturer Part: 0402WGF3303TCE; Supplier: LCSC; Supplier Part: C25778; LCSC Part Name: 330kΩ ±1% 62.5mW 厚膜电阻; Supplier Footprint: 0402; JLCPCB Part Class: Extended Part; Datasheet: https://item.szlcsc.com/datasheet/0402WGF3303TCE/26521.html; Type: Thick Film Resistor; Value: 330kΩ; Temperature Coefficient: ±100ppm/℃; Operating Temperature: -55℃~+155℃; FootprintName: R0402
R22 R23 = 0402WGF3300TCE: Type:Thick Film Resistors Resistance:330Ω Tolerance:±1% Tolerance:±1% Power(Watts):1/16W Voltage-Supply(Max):50V Temperature Coefficient:±100ppm/℃ Temperature Coefficient:±100ppm/℃ Operating Temperature:-55℃~+155℃ Operating Temperature:-55℃~+155℃; Manufacturer: UNI-ROYAL(厚声); Add into BOM: yes; Tolerance: ±1%; Power(Watts): 1/16W; Voltage-Supply(Max): 50V; ModelId: efdecb7dae4442949d28eecaf748420f0819f05c4eef4c71ace90d822a990e87; ModelName: R0402_L1.0-W0.5-H0.4; ModelTransform: 39.37,19.685,0,0,0,0,0,0,0; Symbol: 0402WGF3300TCE; Device: 0402WGF3300TCE; Convert to PCB: yes; Manufacturer Part: 0402WGF3300TCE; Supplier: LCSC; Supplier Part: C25104; Value: 330Ω; JLCPCB Part Class: Basic Part; LCSC Part Name: 330Ω ±1% 62.5mW 厚膜电阻; Supplier Footprint: 0402; Datasheet: https://item.szlcsc.com/datasheet/0402WGF3300TCE/25847.html; Type: Thick Film Resistors; Temperature Coefficient: ±100ppm/℃; Operating Temperature: -55℃~+155℃; FootprintName: R0402
R24 = 0402WGF2001TCE: Type:Thick Film Resistor Resistance:2kΩ Tolerance:±1% Tolerance:±1% Power(Watts):62.5mW Voltage-Supply(Max):50V Temperature Coefficient:±100ppm/℃ Temperature Coefficient:±100ppm/℃ Operating Temperature:-55℃~+155℃ Operating Temperature:-55℃~+155℃; Manufacturer: UNI-ROYAL(厚声); Add into BOM: yes; Tolerance: ±1%; Power(Watts): 62.5mW; Voltage-Supply(Max): 50V; ModelId: efdecb7dae4442949d28eecaf748420f0819f05c4eef4c71ace90d822a990e87; ModelName: R0402_L1.0-W0.5-H0.4; ModelTransform: 39.37,19.685,0,0,0,0,0,0,0; Symbol: 0402WGF2001TCE; Device: 0402WGF2001TCE; Convert to PCB: yes; Manufacturer Part: 0402WGF2001TCE; Supplier: LCSC; Supplier Part: C4109; Value: 2kΩ; JLCPCB Part Class: Basic Part; LCSC Part Name: 厚膜电阻 2kΩ ±1%; Supplier Footprint: 0402; Datasheet: https://item.szlcsc.com/datasheet/0402WGF2001TCE/4516.html; Type: Thick Film Resistor; Temperature Coefficient: ±100ppm/℃; Operating Temperature: -55℃~+155℃; FootprintName: R0402
R25 = 0402WGF1003TCE: Type:Thick Film Resistor Resistance:100kΩ Tolerance:±1% Tolerance:±1% Power(Watts):62.5mW Voltage-Supply(Max):50V Temperature Coefficient:±100ppm/℃ Temperature Coefficient:±100ppm/℃ Operating Temperature:-55℃~+155℃ Operating Temperature:-55℃~+155℃; Manufacturer: UNI-ROYAL(厚声); Add into BOM: yes; 3D Model: efdecb7dae4442949d28eecaf748420f0819f05c4eef4c71ace90d822a990e87; 3D Model Transform: 39.37,19.685,0,0,0,0,0,0,0; Tolerance: ±1%; Power(Watts): 62.5mW; Voltage-Supply(Max): 50V; ModelName: R0402_L1.0-W0.5-H0.4; Symbol: 0402WGF1003TCE; Device: 0402WGF1003TCE; Convert to PCB: yes; LCSC Part Name: 厚膜电阻 100kΩ ±1%; Supplier Footprint: 0402; Datasheet: https://item.szlcsc.com/datasheet/0402WGF1003TCE/26484.html; Type: Thick Film Resistor; Temperature Coefficient: ±100ppm/℃; Operating Temperature: -55℃~+155℃; Manufacturer Part: 0402WGF1003TCE; Supplier: LCSC; Supplier Part: C25741; Value: 100kΩ; JLCPCB Part Class: Basic Part; FootprintName: R0402
RS1 = 0603WAF100KT5E: Type:Thick Film Resistor Resistance:1Ω Tolerance:±1% Tolerance:±1% Power(Watts):100mW Voltage-Supply(Max):75V Temperature Coefficient:±400ppm/℃ Temperature Coefficient:±400ppm/℃ Operating Temperature:-55℃~+155℃ Operating Temperature:-55℃~+155℃; Manufacturer: UNI-ROYAL(厚声); Add into BOM: yes; Tolerance: ±1%; Power(Watts): 100mW; Voltage-Supply(Max): 75V; ModelId: 112863783b5b41f1b5254f87eedc79320819f05c4eef4c71ace90d822a990e87; ModelTransform: 31.8897,63.7794,0,90,0,0,0,0,0; Symbol: 0603WAF100KT5E; Device: 0603WAF100KT5E; Convert to PCB: yes; Manufacturer Part: 0603WAF100KT5E; Supplier: LCSC; Supplier Part: C22936; Value: 1Ω; JLCPCB Part Class: Basic Part; LCSC Part Name: 1Ω ±1% 100mW 厚膜电阻; Supplier Footprint: 0603; Datasheet: https://item.szlcsc.com/datasheet/0603WAF100KT5E/23663.html; Type: Thick Film Resistor; Temperature Coefficient: ±400ppm/℃; Operating Temperature: -55℃~+155℃; FootprintName: R0603; ModelName: R0603
SW1 = SKSCLAE010: Circuit:SPST-NO Actuator Style:Rectangular Button Operating Force:2.24N Mounting Type:Surface Mount, Right Angle Length:3.5mm Width:2.9mm Switch Height:1.25mm Contact Current:50mA Voltage Rating:12V With Lamp:- Termination Style:J-Lead Life:100,000 cycles; Manufacturer: ALPSALPINE(阿尔卑斯阿尔派); Add into BOM: yes; Operating Force: 2.24N; Switch Height: 1.25mm; Contact Current: 50mA; Voltage Rating: 12V; ModelId: dd46d988a7b04db8be8fb565e511e88d0819f05c4eef4c71ace90d822a990e87; ModelName: SW-SMD_4P-L3.5-W2.9-P1.30-LS4; ModelTransform: 190.9445,139.7635,0,0,0,0,-0.591,-13.386,0; Symbol: SKSCLAE010; Device: SKSCLAE010; Convert to PCB: yes; Manufacturer Part: SKSCLAE010; Supplier: LCSC; Supplier Part: C130445; JLCPCB Part Class: Extended Part; LCSC Part Name: 3.5*2.9*1.25mm 卧贴 轻触开关; Supplier Footprint: SMD,3.5x2.9mm; Datasheet: https://item.szlcsc.com/datasheet/SKSCLAE010/141733.html; Circuit: SPST-NO; Actuator Style: Rectangular Button; Mounting Type: Surface Mount, Right Angle; Length: 3.5mm; Width: 2.9mm; With Lamp: -; Termination Style: J-Lead; Life: 100,000 cycles; Operating Temperature: -30℃~+85℃; FootprintName: SW-SMD_4P-L3.5-W2.9-P1.30-LS4.8
TH1 = NCP15WF104F03RC: Power(Watts):100mW Resistance @ 25℃:100kΩ Resistance Tolerance:±1% Resistance Tolerance:±1% B Constant Tolerance:±1% B Constant (25℃/50℃):4250K B Constant (25℃/75℃):- B Constant (25℃/85℃):4311K B Constant (25℃/100℃):4334K Steady State Current (Max):100uA; Manufacturer: muRata(村田); Add into BOM: yes; Power(Watts): 100mW; Resistance @ 25℃: 100kΩ; Resistance Tolerance: ±1%; B Constant (25℃/50℃): 4250K; B Constant (25℃/85℃): 4311K; B Constant (25℃/100℃): 4334K; Steady State Current (Max): 100uA; Dissipation Factor: 1mW/℃; ModelId: efdecb7dae4442949d28eecaf748420f0819f05c4eef4c71ace90d822a990e87; ModelName: R0402_L1.0-W0.5-H0.4; ModelTransform: 39.37,19.685,0,0,0,0,0,0,0; Symbol: NCP15WF104F03RC; Device: NCP15WF104F03RC; Convert to PCB: yes; Manufacturer Part: NCU15WF104F6SRC; Supplier: LCSC; Supplier Part: C458473; LCSC Part Name: 100kΩ 4250K 100mW; Supplier Footprint: 0402; JLCPCB Part Class: Extended Part; Datasheet: https://item.szlcsc.com/datasheet/NCP15WF104F03RC/78257.html; B Constant Tolerance: ±1%; B Constant (25℃/75℃): -; Operating Temperature: -40℃~+125℃; Length: 1mm; Width: 0.5mm; FootprintName: R0402
TH2 = NCP15XH103F03RC: Resistance @ 25℃:10kΩ B Constant (25℃/50℃):3380K Resistance Tolerance:±1% Resistance Tolerance:±1% B Constant (25℃/75℃):- B Constant (25℃/85℃):3434K B Constant (25℃/100℃):3455K Power(Watts):100mW B Constant Tolerance:±1% Steady State Current (Max):310uA O; Manufacturer: muRata(村田); Add into BOM: yes; Resistance @ 25℃: 10kΩ; B Constant (25℃/50℃): 3380K; Resistance Tolerance: ±1%; B Constant (25℃/85℃): 3434K; B Constant (25℃/100℃): 3455K; Power(Watts): 100mW; Steady State Current (Max): 310uA; Dissipation Factor: 1mW/℃; ModelId: efdecb7dae4442949d28eecaf748420f0819f05c4eef4c71ace90d822a990e87; ModelName: R0402_L1.0-W0.5-H0.4; ModelTransform: 39.37,19.685,0,0,0,0,0,0,0; Symbol: NCP15XH103F03RC; Device: NCP15XH103F03RC; Convert to PCB: yes; Manufacturer Part: NCP15XH103F03RC; Supplier: LCSC; Supplier Part: C77131; LCSC Part Name: 10kΩ 3380K 100mW; Supplier Footprint: 0402; JLCPCB Part Class: Extended Part; Datasheet: https://item.szlcsc.com/datasheet/NCP15XH103F03RC/78258.html; B Constant (25℃/75℃): -; B Constant Tolerance: ±1%; Operating Temperature: -40℃~+125℃; Length: 1mm; Width: 0.5mm; FootprintName: R0402
U1 = CH32V003F4U6: CPU Core:RISC-V2A CPU Maximum Speed:48MHz Core Size:32 Bit Program Storage Size:16KB Program Memory Type:FLASH RAM Size:2KB EEPROM:- Number of I/O:18 ADC (Bit):10bit DAC (Bit):- Oscillator Type:Built-in+External Voltage - Supply:3.3V；5V Voltage - Supply:3; Manufacturer: WCH(南京沁恒); Add into BOM: yes; CPU Maximum Speed: 48MHz; Core Size: 32 Bit; Program Storage Size: 16KB; Program Memory Type: FLASH; RAM Size: 2KB; Number of I/O: 18; ADC (Bit): 10bit; ModelId: 4fcaa6a9742c4ad192fb74c34edb04f30819f05c4eef4c71ace90d822a990e87; ModelName: QFN-20_L3.0-W3.0-H0.6-P0.40-BL; ModelTransform: 118.11,118.11,0,0,0,0,0,0,0; Symbol: CH32V003F4U6; Device: CH32V003F4U6; Convert to PCB: yes; Manufacturer Part: CH32V003F4U6; Supplier: LCSC; Supplier Part: C5299908; LCSC Part Name: QingKe V2微处理器; Supplier Footprint: QFN-20(3X3); JLCPCB Part Class: Extended Part; Datasheet: https://item.szlcsc.com/datasheet/CH32V003F4U6/6049934.html; CPU Core: RISC-V2A; EEPROM: -; DAC (Bit): -; Oscillator Type: Built-in+External; Voltage - Supply: 3.3V；5V; Operating Temperature: -40℃~+85℃; Features: -; FootprintName: QFN-20_L3.0-W3.0-P0.40-TL-EP1.7
U2 = BQ24040DSQR: The Chip Type:Charging IC Voltage - Supply:3.5V~28V Voltage - Supply:3.5V~28V Charge Current - Max:1A Charging Saturation Voltage:4.2V End-Off Voltage:800mV Type of Battery:Lithium Battery Number of Cells:1 Number of Cells:1 Operating Temperature:0℃~+125℃; Manufacturer: TI(德州仪器); Add into BOM: yes; Charge Current - Max: 1A; Charging Saturation Voltage: 4.2V; End-Off Voltage: 800mV; Number of Cells: 1; Battery Temperature Detection: Support; Supply Current (Iq): 1mA; ModelId: c1037be177b2495ca57c544cfb6053940819f05c4eef4c71ace90d822a990e87; ModelName: WSON-10_L2.0-W2.0-H0.8-P0.40; ModelTransform: 78.74,79.527,0,0,0,0,0,0,0; Symbol: BQ24040DSQR; Device: BQ24040DSQR; Convert to PCB: yes; Manufacturer Part: BQ24040DSQR; Supplier: LCSC; Supplier Part: C81080; LCSC Part Name: 1A单输入单节锂离子和锂聚合物电池充电器; Supplier Footprint: WSON-10-EP(2x2); JLCPCB Part Class: Extended Part; Datasheet: https://www.ti.com/cn/lit/ds/symlink/bq24040.pdf; The Chip Type: Charging IC; Voltage - Supply: 3.5V~28V; Type of Battery: Lithium Battery; Operating Temperature: 0℃~+125℃; 0V Battery Charge: Support; Balance Current: -; Interface: -; Features: Overcurrent Protection；Constant voltage charging；Constant current charging；Automatic recharge；Charge termination；Programmable charging current；Overvoltage protection；Under-voltage lockout；Trickle charging；Short-Circuit  Protection; FootprintName: WSON-10_L2.0-W2.0-P0.40-BL-EP
U3 = TPS61023DRLT: Function:Boost Voltage - Supply:500mV~5.5V Voltage - Supply:500mV~5.5V Output Voltage:2.2V~5.5V Output Voltage:2.2V~5.5V Output Current:3A Frequency - Switching:1MHz Frequency - Switching:1MHz Operating Temperature:-40℃~+125℃@(TJ) Operating Temperature:-4; Manufacturer: TI(德州仪器); Add into BOM: yes; Function: Boost; Output Current: 3A; Frequency - Switching: 1MHz; Number of Outputs: 1; Quiescent Current: 3uA; Switch tube (built-in/external): Built-in; Output Type: Adjustable; ModelId: 6198c2bb37bd48baa3e7245a3bc9feca0819f05c4eef4c71ace90d822a990e87; ModelName: SOT-563-6_L1.6-W1.2-P0.5-LS1.6-BL; ModelTransform: 62.992,62.992,0,90,0,0,0,0,0; Symbol: TPS61023DRLT; Device: TPS61023DRLT; Convert to PCB: yes; Manufacturer Part: TPS61023DRLR; Supplier: LCSC; Supplier Part: C919459; LCSC Part Name: 升压型 3A 500mV~5.5V; Supplier Footprint: SOT-563; JLCPCB Part Class: Extended Part; Datasheet: https://www.ti.com/cn/lit/ds/symlink/tps61023.pdf; Voltage - Supply: 500mV~5.5V; Output Voltage: 2.2V~5.5V; Operating Temperature: -40℃~+125℃@(TJ); Synchronous Rectifier: Yes; Topology: Boost; Features: Light load efficient mode；Overcurrent Protection；Load disconnect; FootprintName: SOT-563-6_L1.6-W1.2-P0.5-LS1.6-BR
U4 = SY6280AAC_C55136: Type:High Side Switch Number of Channels:1 Control Input Logic:Active High Voltage - Supply:2.4V~5.5V Voltage - Supply:2.4V~5.5V Maximum Continuous Current:2A RDS(on):80mΩ Features:Short-Circuit  Protection；Overcurrent Protection；Reverse current blocking；; Manufacturer: Silergy(矽力杰); Add into BOM: yes; Number of Channels: 1; Maximum Continuous Current: 2A; RDS(on): 80mΩ; ModelId: 3168b22659ce4998ae232d44bb704e0a0819f05c4eef4c71ace90d822a990e87; ModelName: SOT-23-5_L2.9-W1.6-H1.1-LS2.8-P0.95; ModelTransform: 118.60433,114.173,0,90,0,0,0.0005,0.0005,0; Symbol: SY6280AAC; Device: SY6280AAC_C55136; Convert to PCB: yes; Manufacturer Part: SY6280AAC; Supplier: LCSC; Supplier Part: C55136; LCSC Part Name: 低损耗功率分配开关; Supplier Footprint: SOT-23-5; JLCPCB Part Class: Extended Part; Datasheet: https://item.szlcsc.com/datasheet/SY6280AAC/56162.html; Type: High Side Switch; Control Input Logic: Active High; Voltage - Supply: 2.4V~5.5V; Features: Short-Circuit  Protection；Overcurrent Protection；Reverse current blocking；Output discharge function；Over temperature protection; Operating Temperature	-: -40℃~+125℃; FootprintName: SOT-23-5_L3.0-W1.7-P0.95-LS2.8-BL
U5 U6 = SN74LVC1T45DBVR: Channel Type:Bidirectional Input Signal:- Output Signal:- Data Rate:420Mbps Voltage - Supply(VCCA):1.65V~5.5V Voltage - Supply(VCCA):1.65V~5.5V Voltage - Supply(VCCB):1.65V~5.5V Voltage - Supply(VCCB):1.65V~5.5V Number of Elements:1 Number of Circuits:1 O; Manufacturer: TI(德州仪器); Add into BOM: yes; Number of Elements: 1; Output Type: Tri-State; Translator Type: Level translator; ModelId: 1370be37a17e44418ae52e2b4cc1f5e50819f05c4eef4c71ace90d822a990e87; ModelName: SOT-23-6_L2.9-W1.6-H1.5-LS2.8-P0.95; ModelTransform: 110.73671,114.173,0,180,0,0,0.001,-0.003,0; Symbol: SN74LVC1T45DBVR; Device: SN74LVC1T45DBVR; Convert to PCB: yes; Manufacturer Part: SN74LVC1T45DBVR; Supplier: LCSC; Supplier Part: C7843; LCSC Part Name: 单比特双电源总线收发器，带可配置电压转换和三态输出; Supplier Footprint: SOT-23-6; JLCPCB Part Class: Extended Part; Datasheet: https://www.ti.com/cn/lit/ds/symlink/sn74lvc1t45.pdf; Channel Type: Bidirectional; Input Signal: -; Output Signal: -; Data Rate: 420Mbps; Voltage - Supply(VCCA): 1.65V~5.5V; Voltage - Supply(VCCB): 1.65V~5.5V; Number of Circuits: 1; Operating Temperature: -40℃~+85℃; Features: Power-off protection；Output enable high-impedance; Current - Output Low(IOL): -; Current - Output High(IOH): -; Interface: -; FootprintName: SOT-23-6_L2.9-W1.6-P0.95-LS2.8-BR
U7 = XC6206P182MR_C21659: Output Configuration:Positive Voltage - Supply:6V Output Voltage:1.8V Output Voltage:1.8V Output Current:200mA Power Supply Rejection Ratio (PSRR):- Voltage Dropout:780mV@(60mA) standby current:1uA Noise:- Features:Short Circuit Protection；Over Current Pr; Manufacturer: TOREX(特瑞仕); Add into BOM: yes; Voltage - Supply: 6V; Output Voltage: 1.8V; Output Current: 200mA; standby current: 1uA; Output Type: Fixed; Number of Outputs: 1; ModelId: 4eed685bb9f4439b846746bc2193f3c00819f05c4eef4c71ace90d822a990e87; ModelName: SOT-23-3L_L2.9-W1.6-H1.1-LS2.8-P0.95; ModelTransform: 114.173,110.236,0,90,0,0,0,0,0; Symbol: XC6206P182MR; Device: XC6206P182MR_C21659; Convert to PCB: yes; Manufacturer Part: XC6206P182MR; Supplier: LCSC; Supplier Part: C21659; LCSC Part Name: 1.8V 200mA 6V; Supplier Footprint: SOT-23-3L; JLCPCB Part Class: Extended Part; Datasheet: https://item.szlcsc.com/datasheet/XC6206P182MR/22380.html; Output Configuration: Positive; Power Supply Rejection Ratio (PSRR): -; Voltage Dropout: 780mV@(60mA); Noise: -; Features: Short Circuit Protection；Over Current Protection; Operating Temperature: -40℃~+85℃@(Ta); FootprintName: SOT-23-3_L2.9-W1.6-P1.90-LS2.8-BR
U8 = HAL248 SW: Type:Omnipolar Voltage - Supply:1.8V~5.5V Voltage - Supply:1.8V~5.5V Operation Points:±3mT Operation Points:±3mT Release Points:±1.8mT Release Points:±1.8mT Output Current:1mA Operating Current:3uA BHYS:1.2mT Output Type:Open-drain Operating Temperature:-; Manufacturer: Hallwee(霍尔微电子); Add into BOM: yes; Operation Points: ±3mT; Release Points: ±1.8mT; Output Current: 1mA; Operating Current: 3uA; BHYS: 1.2mT; ModelId: b7f62b6ee5214f0798238d8f3506a18a0819f05c4eef4c71ace90d822a990e87; ModelTransform: 63.031,63.7794,0,0,0,0,-0.005,-0.005,0; Symbol: HAL248 SW; Device: HAL248 SW; Convert to PCB: yes; Manufacturer Part: HAL248 SW; Supplier: LCSC; Supplier Part: C6320892; LCSC Part Name: HAL248 SW; Supplier Footprint: DFNWB-6(1.6x1.6); JLCPCB Part Class: Extended Part; Datasheet: https://item.szlcsc.com/datasheet/HAL248%2520SW/7268731.html; Type: Omnipolar; Voltage - Supply: 1.8V~5.5V; Output Type: Open-drain; Operating Temperature: -40℃~+125℃; Features: Built-in hysteresis latch；Built-in oscillator; FootprintName: DFN-6_HAL248_SW; ModelName: DFN-6_HAL248_SW